# Altium schematic sheet 3_BQ25756 Charger.SchDoc
size A2; Date: Not shown in title block; ApprovedBy: Not shown in title block; CheckedBy: Not shown in title block; Author: Not shown in title block; CompanyName: Not shown in title block; Engineer: Not shown in title block; Organization: Not shown in title block; Address1: Not shown in title block; Address2: Not shown in title block; Address3: Not shown in title block; Address4: Not shown in title block; DocumentNumber: 1; Revision: Use project parameter SCH_Rev; SheetNumber: 3; SheetTotal: 4; PageSetup: Record=PageOptions|CenterHorizontal=True|CenterVertical=True|PrintScale=0.69|XCorrection=1.00|YCorrection=1.00|PrintKind=0|BorderSize=5000000|LeftOffset=0|BottomOffset=0|Orientation=2|PaperLength=1000|PaperWidth=1000|Scale=100|PaperSource=15|PrintQuality=600|MediaType=1|DitherType=10|PaperKind=Letter|PrintScaleMode=1; CurrentTime: Not shown in title block; CurrentDate: Not shown in title block; Time: Not shown in title block; DocumentFullPathAndName: Not shown in title block; DocumentName: Not shown in title block; ModifiedDate: Not shown in title block; ImagePath: Not shown in title block
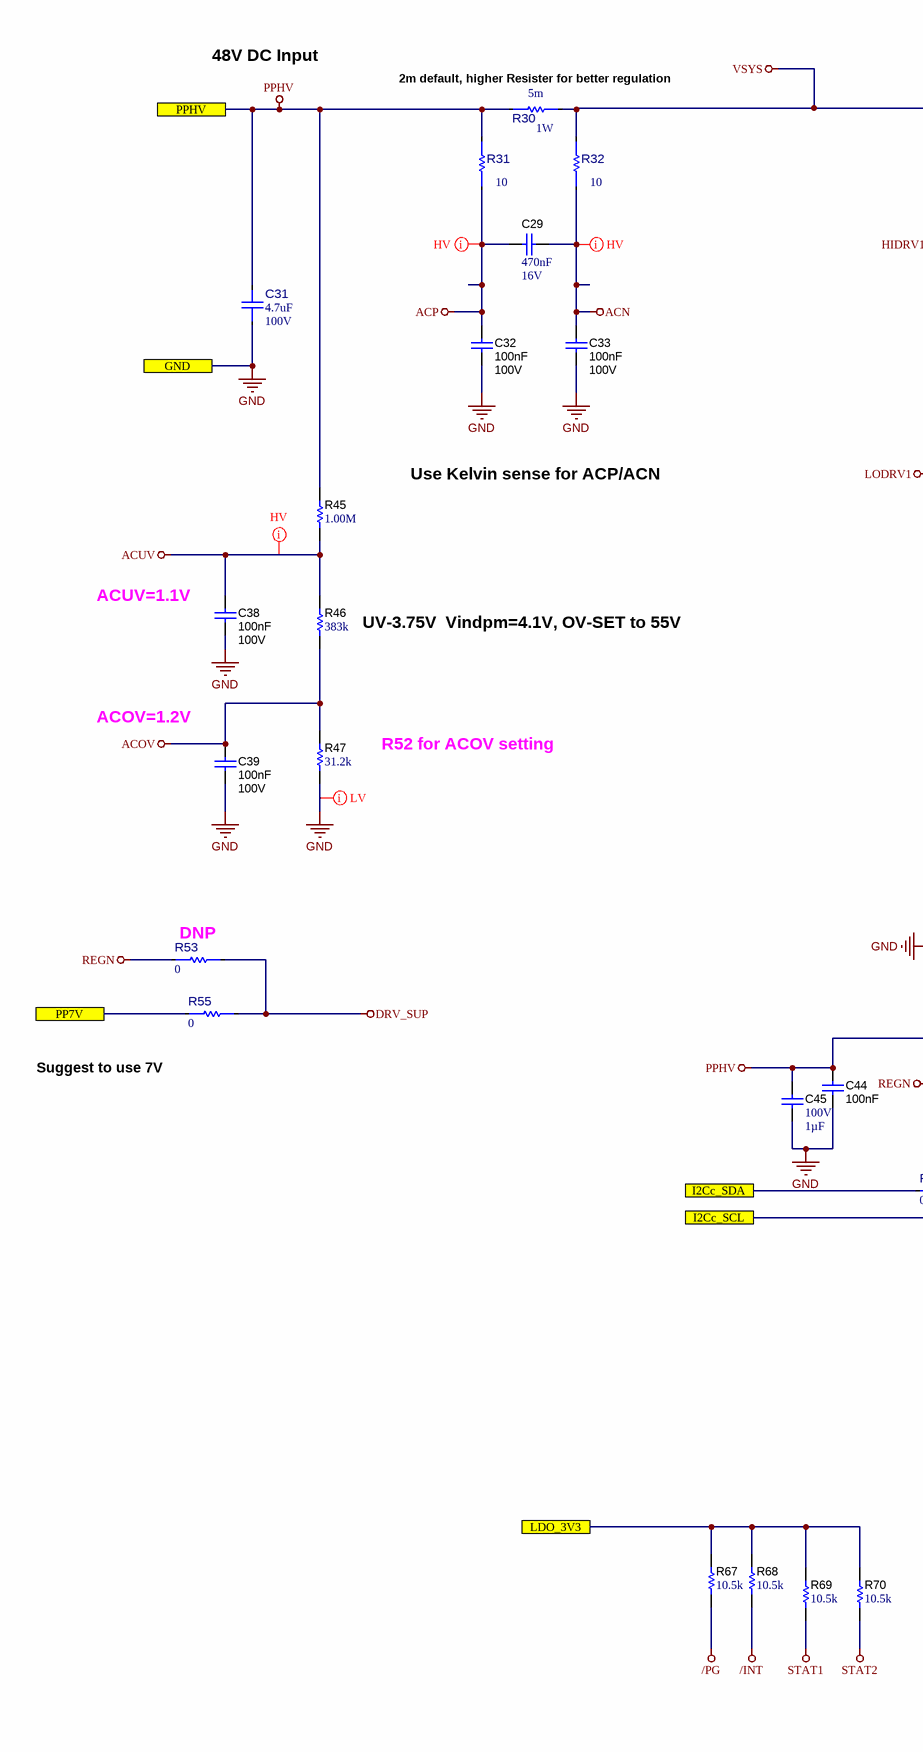
[diagram p0: 3_BQ25756 Charger.SchDoc, left]
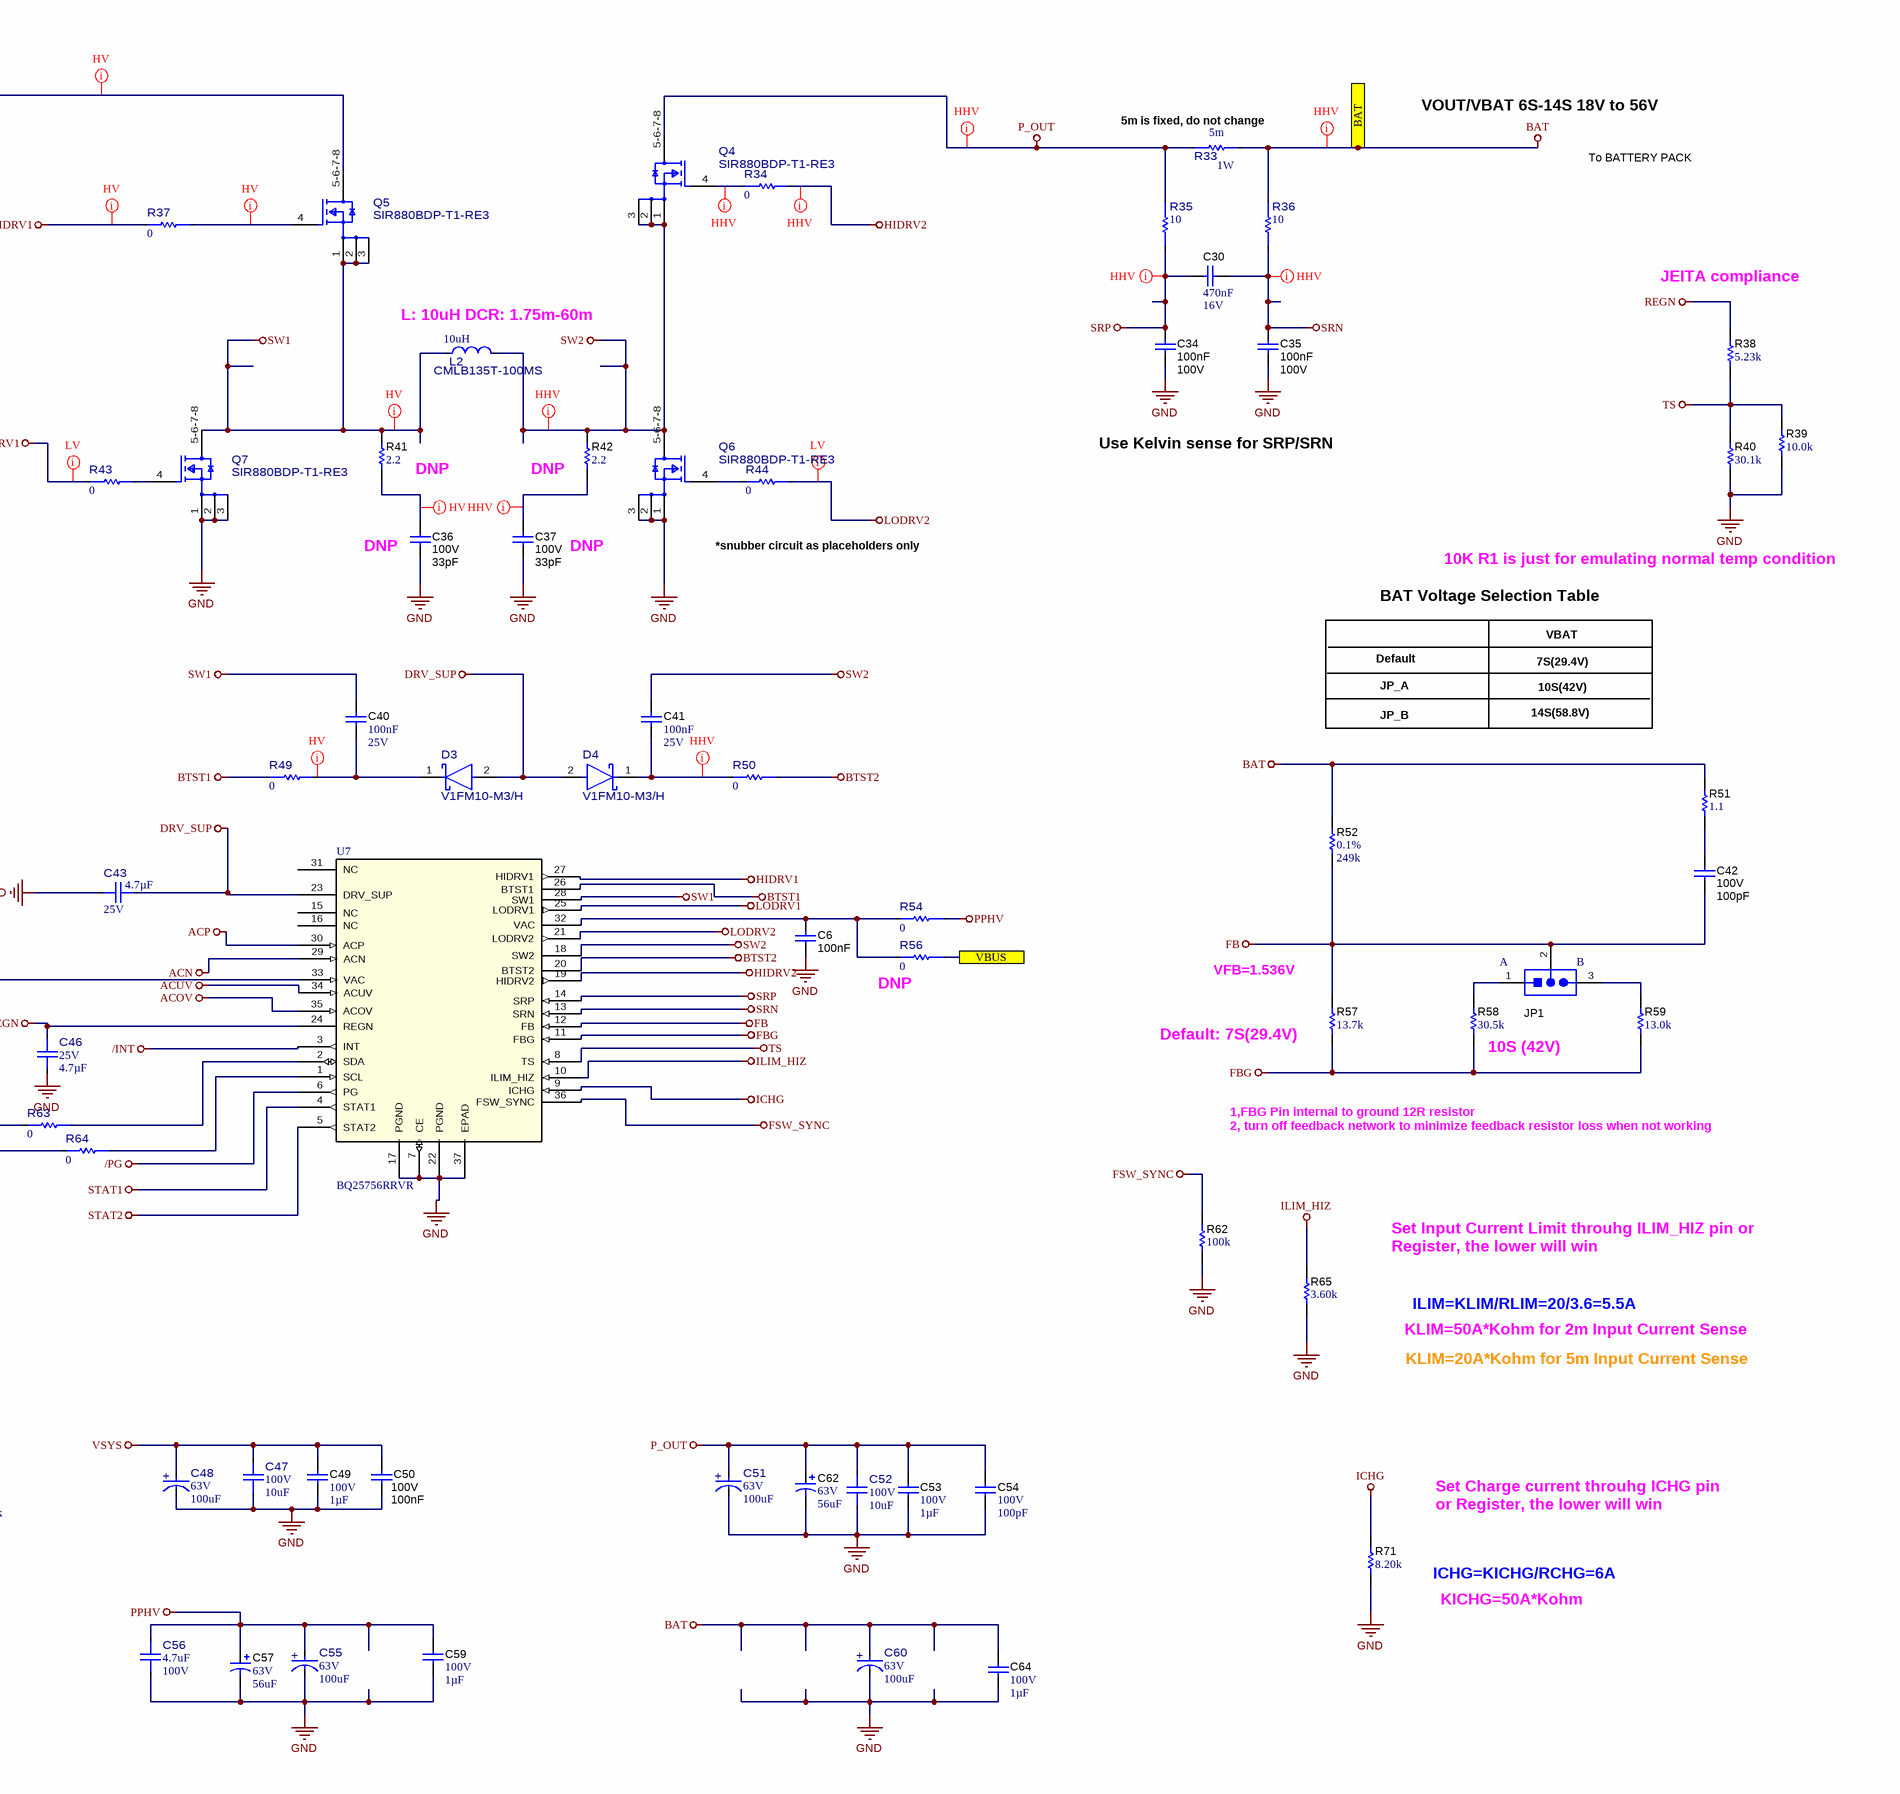
[diagram p1: 3_BQ25756 Charger.SchDoc, right]

## Parts
C6  Cap_F: 100nF  [0603_HV]  (hidden comment: HMK107B7104KAHT)
C29  Cap_F: 470nF  VDC_V: 16V  [0603]  (hidden comment: C0603C474K4RACTU)
C30  Cap_F: 470nF  VDC_V: 16V  [0603]  (hidden comment: C0603C474K4RACTU)
C31  ValueDisplayed: 4.7uF  VDC_V: 100V  [FP-GCJ32DC72A475KE01L_1210-MFG]  (hidden comment: GCJ32DC72A475KE01L)
C32  Cap_F: 100nF  VDC_V: 100V  [0603_HV]  (hidden comment: HMK107B7104KAHT)
C33  Cap_F: 100nF  VDC_V: 100V  [0603_HV]  (hidden comment: HMK107B7104KAHT)
C34  Cap_F: 100nF  VDC_V: 100V  [0603_HV]  (hidden comment: HMK107B7104KAHT)
C35  Cap_F: 100nF  VDC_V: 100V  [0603_HV]  (hidden comment: HMK107B7104KAHT)
C36  VDC_V: 100V  ValueDisplayed: 33pF  [0603_HV]  (hidden comment: 06031A330JAT2A)
C37  VDC_V: 100V  ValueDisplayed: 33pF  [0603_HV]  (hidden comment: 06031A330JAT2A)
C38  Cap_F: 100nF  VDC_V: 100V  [0603_HV]  (hidden comment: HMK107B7104KAHT)
C39  Cap_F: 100nF  VDC_V: 100V  [0603_HV]  (hidden comment: HMK107B7104KAHT)
C40  Cap_F: 100nF  VDC_V: 25V  [0603_HV]  (hidden comment: 06033C104KAT2A)
C41  Cap_F: 100nF  VDC_V: 25V  [0603_HV]  (hidden comment: 06033C104KAT2A)
C42  VDC_V: 100V  ValueDisplayed: 100pF  [0603_HV]  (hidden comment: GCM1885C2A101JA16D)
C43  VDC_V: 25V  Cap_F: 4.7µF  [FP-CGA4J1X7R1E475K125AE_0805-MFG]  (hidden comment: CGA4J1X7R1E475K125AE)
C44  Cap_F: 100nF  [0603_HV]  (hidden comment: HMK107B7104KAHT)
C45  VDC_V: 100V  Cap_F: 1µF  [0805_150]  (hidden comment: 08051C105K4Z2A)
C46  VDC_V: 25V  Cap_F: 4.7µF  [FP-CGA4J1X7R1E475K125AE_0805-MFG]  (hidden comment: CGA4J1X7R1E475K125AE)
C47  VDC_V: 100V  ValueDisplayed: 10uF  [FP-C3225X7R2A106K250AC_1210-MFG]  (hidden comment: C3225X7R2A106K250AC)
C48  VDC_V: 63V  ValueDisplayed: 100uF  [FP-PCR1J101MCL1GS_SMD_RADIAL-MFG]  (hidden comment: PCR1J101MCL1GS)
C49  VDC_V: 100V  Cap_F: 1µF  [0805_150]  (hidden comment: 08051C105K4Z2A)
C50  Cap_F: 100nF  VDC_V: 100V  [0603L]  (hidden comment: HMK107B7104KAHT)
C51  VDC_V: 63V  ValueDisplayed: 100uF  [FP-PCR1J101MCL1GS_SMD_RADIAL-MFG]  (hidden comment: PCR1J101MCL1GS)
C52  VDC_V: 100V  ValueDisplayed: 10uF  [FP-C3225X7R2A106K250AC_1210-MFG]  (hidden comment: C3225X7R2A106K250AC)
C53  VDC_V: 100V  Cap_F: 1µF  [0805_150]  (hidden comment: 08051C105K4Z2A)
C54  VDC_V: 100V  ValueDisplayed: 100pF  [0603]  (hidden comment: CGA3E2C0G2A101J080AA)
C55  VDC_V: 63V  ValueDisplayed: 100uF  [FP-PCR1J101MCL1GS_SMD_RADIAL-MFG]  (hidden comment: PCR1J101MCL1GS)
C56  ValueDisplayed: 4.7uF  VDC_V: 100V  [FP-GCJ32DC72A475KE01L_1210-MFG]  (hidden comment: GCJ32DC72A475KE01L)
C57  VDC_V: 63V  ValueDisplayed: 56uF  [SM_RADIAL_10BMM]  (hidden comment: EEHZC1J560P)
C59  VDC_V: 100V  Cap_F: 1µF  [0805_150]  (hidden comment: 08051C105K4Z2A)
C60  VDC_V: 63V  ValueDisplayed: 100uF  [FP-PCR1J101MCL1GS_SMD_RADIAL-MFG]  (hidden comment: PCR1J101MCL1GS)
C62  VDC_V: 63V  ValueDisplayed: 56uF  [SM_RADIAL_10BMM]  (hidden comment: EEHZC1J560P)
C64  VDC_V: 100V  Cap_F: 1µF  [0805_150]  (hidden comment: 08051C105K4Z2A)
D3  V1FM10-M3/H  [FP-V1FM10-M3-H_DO-219AB-MFG]
D4  V1FM10-M3/H  [FP-V1FM10-M3-H_DO-219AB-MFG]
JP1  PEC03SAAN  [CONN_PEC03SAAN]  (value not drawn)
L2  CMLB135T-100MS  value 10uH  [FP-CMLB135T-100MS_SMT2_13MM45_12Mm6-MFG]
Q4  SIR880BDP-T1-RE3  [FP-SIR880BDP-T1-RE3_SO-8-MFG]
Q5  SIR880BDP-T1-RE3  [FP-SIR880BDP-T1-RE3_SO-8-MFG]
Q6  SIR880BDP-T1-RE3  [FP-SIR880BDP-T1-RE3_SO-8-MFG]
Q7  SIR880BDP-T1-RE3  [FP-SIR880BDP-T1-RE3_SO-8-MFG]
R30  Res_ohm: 5m  Power_W: 1W  [FP-WSL25125L000FEA_2512-MFG]  (hidden comment: WSL25125L000FEA)
R31  value 10  [FP-CRCW060310R0FKEB_0603-MFG]  (hidden comment: CRCW060310R0FKEB)
R32  value 10  [FP-CRCW060310R0FKEB_0603-MFG]  (hidden comment: CRCW060310R0FKEB)
R33  Res_ohm: 5m  Power_W: 1W  [FP-WSL25125L000FEA_2512-MFG]  (hidden comment: WSL25125L000FEA)
R34  value 0  [FP-CRCW06031R50FKEAHP_0603-MFG]  (hidden comment: CRCW06030000Z0EA)
R35  value 10  [FP-CRCW060310R0FKEB_0603-MFG]  (hidden comment: CRCW060310R0FKEB)
R36  value 10  [FP-CRCW060310R0FKEB_0603-MFG]  (hidden comment: CRCW060310R0FKEB)
R37  value 0  [FP-CRCW06031R50FKEAHP_0603-MFG]  (hidden comment: CRCW06030000Z0EA)
R38  ValueDisplayed: 5.23k  [0603]  (hidden comment: RC0603FR-075K23L)
R39  ValueDisplayed: 10.0k  [0603]  (hidden comment: ERJ-3EKF1002V)
R40  ValueDisplayed: 30.1k  [0603]  (hidden comment: RC0603FR-0730K1L)
R41  ValueDisplayed: 2.2  [0805_HV]  (hidden comment: RC0805JR-072R2L)
R42  ValueDisplayed: 2.2  [0805_HV]  (hidden comment: RC0805JR-072R2L)
R43  value 0  [FP-CRCW06031R50FKEAHP_0603-MFG]  (hidden comment: CRCW06030000Z0EA)
R44  value 0  [FP-CRCW06031R50FKEAHP_0603-MFG]  (hidden comment: CRCW06030000Z0EA)
R45  ValueDisplayed: 1.00M  [0805_HV]  (hidden comment: CRCW08051M00FKEAC)
R46  ValueDisplayed: 383k  [0603]  (hidden comment: RT0603BRD07383KL)
R47  ValueDisplayed: 31.2k  [0603]  (hidden comment: RT0603BRD0731K2L)
R49  value 0  [FP-CRCW06031R50FKEAHP_0603-MFG]  (hidden comment: CRCW06030000Z0EA)
R50  value 0  [FP-CRCW06031R50FKEAHP_0603-MFG]  (hidden comment: CRCW06030000Z0EA)
R51  ValueDisplayed: 1.1  [0603]  (hidden comment: CRCW06031R10JNEA)
R52  Value1: 0.1%  ValueDisplayed: 249k  [0805_HV]  (hidden comment: ERJ-PB6B2493V)
R53  value 0  [FP-CRCW06031R50FKEAHP_0603-MFG]  (hidden comment: CRCW06030000Z0EA)
R54  value 0  [FP-CRCW06031R50FKEAHP_0603-MFG]  (hidden comment: CRCW06030000Z0EA)
R55  value 0  [FP-CRCW06031R50FKEAHP_0603-MFG]  (hidden comment: CRCW06030000Z0EA)
R56  value 0  [FP-CRCW06031R50FKEAHP_0603-MFG]  (hidden comment: CRCW06030000Z0EA)
R57  ValueDisplayed: 13.7k  [0603]  (hidden comment: RT0603BRD0713K7L)
R58  ValueDisplayed: 30.5k  [0603]  (hidden comment: RT0603BRD0730K5L)
R59  ValueDisplayed: 13.0k  [0603]  (hidden comment: RT0603BRD0713KL)
R62  ValueDisplayed: 100k  [0603]  (hidden comment: RC0603FR-07100KL)
R63  value 0  [FP-CRCW080510R0JNEAHP_0805-MFG]  (hidden comment: CRCW08050000Z0EA)
R64  value 0  [FP-CRCW080510R0JNEAHP_0805-MFG]  (hidden comment: CRCW08050000Z0EA)
R65  ValueDisplayed: 3.60k  [0603]  (hidden comment: RC0603FR-073K6L)
R67  ValueDisplayed: 10.5k  [0402]  (hidden comment: RC0402FR-0710K5L)
R68  ValueDisplayed: 10.5k  [0402]  (hidden comment: RC0402FR-0710K5L)
R69  ValueDisplayed: 10.5k  [0402]  (hidden comment: RC0402FR-0710K5L)
R70  ValueDisplayed: 10.5k  [0402]  (hidden comment: RC0402FR-0710K5L)
R71  ValueDisplayed: 8.20k  [0603]  (hidden comment: RG1608P-822-B-T5)
U7  BQ25756RRVR  [VQFN36_RRV_TEX]

## Ports
BAT, GND, I2Cc_SCL, I2Cc_SDA, LDO_3V3, PP7V, PPHV, VBUS

## Nets
/INT: R68.1 U7.3(INT)
/PG: R67.1 U7.6(PG)
ACN: C29.2 C33.1 R32.1 U7.29(ACN)
ACOV: C39.1 R46.1 R47.2 U7.35(ACOV)
ACP: C29.1 C32.1 R31.1 U7.30(ACP)
ACUV: C38.1 R45.1 R46.2 U7.34(ACUV)
BAT: C60.2(ANODE) C64.1 R33.2 R36.1 R51.2 R52.2 ; port BAT
BTST1: R49.1 U7.26(BTST1)
BTST2: R50.1 U7.20(BTST2)
DRV_SUP: C43.1 D3.2(ANODE) D4.2(ANODE) R53.2 R55.2 U7.23(DRV_SUP)
FB: C42.2 JP1.2 R52.1 R57.2 U7.12(FB)
FBG: R57.1 R58.1 R59.1 U7.11(FBG)
FSW_SYNC: R62.2 U7.36(FSW_SYNC)
GND: C6.1 C31.1 C32.2 C33.2 C34.2 C35.2 C36.2 C37.2 C38.2 C39.2 C43.2 C44.1 C45.2 C46.2 C47.1 C48.1(CATHODE) C49.2 C50.2 C51.1(CATHODE) C52.1 C53.2 C54.2 C55.1(CATHODE) C56.2 C57.2(-) C59.2 C60.1(CATHODE) C62.2(-) C64.2 Q6.1(S) Q6.2(S) Q6.3(S) Q7.1(S) Q7.2(S) Q7.3(S) R39.1 R40.1 R47.1 R62.1 R65.1 R71.1 U7.7(CE) U7.17(PGND) U7.22(PGND) U7.37(EPAD) ; port GND
HIDRV1: R37.2 U7.27(HIDRV1)
HIDRV2: R34.2 U7.19(HIDRV2)
ICHG: R71.2 U7.9(ICHG)
ILIM_HIZ: R65.2 U7.10(ILIM_HIZ)
LODRV1: R43.1 U7.25(LODRV1)
LODRV2: R44.1 U7.21(LODRV2)
P_OUT: C51.2(ANODE) C52.2 C53.1 C54.1 C62.1(+) Q4.5-6-7-8(D) R33.1 R35.1
PPHV: C31.2 C44.2 C45.1 C55.2(ANODE) C56.1 C57.1(+) C59.1 R30.1 R31.2 R45.2 R54.1 U7.33(VAC) ; port PPHV
REGN: C46.1 R38.2 R53.1 U7.24(REGN)
SRN: C30.2 C35.1 R36.2 U7.13(SRN)
SRP: C30.1 C34.1 R35.2 U7.14(SRP)
STAT1: R69.1 U7.4(STAT1)
STAT2: R70.1 U7.5(STAT2)
SW1: C40.1 L2.1 Q5.1(S) Q5.2(S) Q5.3(S) Q7.5-6-7-8(D) R41.2 U7.28(SW1)
SW2: C41.2 L2.2 Q4.1(S) Q4.2(S) Q4.3(S) Q6.5-6-7-8(D) R42.2 U7.18(SW2)
TS: R38.1 R39.2 R40.2 U7.8(TS)
VSYS: C47.2 C48.2(ANODE) C49.1 C50.1 Q5.5-6-7-8(D) R30.2 R32.2
I2Cc_SCL: R64.2 ; port I2Cc_SCL
I2Cc_SDA: R63.2 ; port I2Cc_SDA
LDO_3V3: R67.2 R68.2 R69.2 R70.2 ; port LDO_3V3
PP7V: R55.1 ; port PP7V
VBUS: R56.1 ; port VBUS
NetC6_2: C6.2 R54.2 R56.2 U7.32(VAC)
NetC36_1: C36.1 R41.1
NetC37_1: C37.1 R42.1
NetC40_2: C40.2 D3.1(CATHODE) R49.2
NetC41_1: C41.1 D4.1(CATHODE) R50.2
NetC42_1: C42.1 R51.1
NetJP1_1: JP1.1 R58.2
NetJP1_3: JP1.3 R59.2
NetQ4_4: Q4.4(G) R34.1
NetQ5_4: Q5.4(G) R37.1
NetQ6_4: Q6.4(G) R44.2
NetQ7_4: Q7.4(G) R43.2
NetR63_1: R63.1 U7.2(SDA)
NetR64_1: R64.1 U7.1(SCL)

Not connected (* = marked no-connect by the designer): U7 15(NC) 16(NC) 31(NC)

## Layout directives
net class HV: ACN, ACP, ACUV, HIDRV1, NetC36_1, NetC40_2, NetQ5_4, SW1, VSYS
net class HHV: BAT, HIDRV2, NetC37_1, NetC41_1, NetQ4_4, P_OUT, SRN, SRP, SW2
net class LV: GND, LODRV1, LODRV2

## Notes on the sheet
- 48V DC Input
- (near R30) 2m default, higher Resister for better regulation
- (near R33) 5m is fixed, do not change
- VOUT/VBAT 6S-14S 18V to 56V
- To BATTERY PACK
- (near L2) L: 10uH DCR: 1.75m-60m
- JEITA compliance
- Use Kelvin sense for ACP/ACN
- Use Kelvin sense for SRP/SRN
- DNP
- (near R42) DNP
- (near C38) ACUV=1.1V
- (near C36) DNP
- *snubber circuit as placeholders only
- 10K R1 is just for emulating normal temp condition
- (near R46) UV-3.75V  Vindpm=4.1V, OV-SET to 55V
- BAT Voltage Selection Table
- VBAT
- (near C39) ACOV=1.2V
- R52 for ACOV setting
- JP_A
- Default
- 7S(29.4V)
- 10S(42V)
- JP_B
- 14S(58.8V)
- (near R53) DNP
- Suggest to use 7V
- (near R56) DNP
- VFB=1.536V
- (near JP1) A
- (near JP1) B
- (near R57) Default: 7S(29.4V)
- (near R58) 10S (42V)
- 1,FBG Pin internal to ground 12R resistor
  2, turn off feedback network to minimize feedback resistor loss when not working
- Set Input Current Limit throuhg ILIM_HIZ pin or Register, the lower will win
- ILIM=KLIM/RLIM=20/3.6=5.5A
- KLIM=50A*Kohm for 2m Input Current Sense
- KLIM=20A*Kohm for 5m Input Current Sense
- Set Charge current throuhg ICHG pin or Register, the lower will win
- KICHG=50A*Kohm
- ICHG=KICHG/RCHG=6A
- Orderable:
- Designed for:
- Mod. Date:
- Texas Instruments and/or its licensors do not warrant the accuracy or completeness of this specification or any information contained therein. Texas Instruments and/or its licensors do not warrant that this design will meet the specifications, will be suitable for your application or fit for any particular purpose, or will operate in an implementation. Texas Instruments and/or its licensors do not warrant that the design is production worthy. You should completely validate and test your design implementation to confirm the system functionality for your application.
- Drawn By:
- Engineer:
- SVN Rev:
- Number:
- TID #:
- Rev:
- Sheet Title:
- File:
- Contact:
- Project Title:
- Assembly Variant:
- Sheet:
- Size:
- of
- A2
- © Texas Instruments
- http://www.ti.com
- (in symbol CMP-0089206-1) +

## Library data of the parts
C6 C44 = CMP-0081011-1: CAP, CERM, 0.1 µF, 100 V,+/- 10%, X7R, AEC-Q200 Grade 1, 0603; Manufacturer: Taiyo Yuden; SizeAreaWB_mm2: 4.68; SizeArea_mm2: 1.28; AEC Qualified: Y; AEC Category: Q200; Value: 0.1uF; TaMax_C: 125°C; SizeZ_mm: 1; Polarized: N; TaMin_C: -55°C; VDC_V: 100V; SizeY_mm: 0.8; U/M: EA; SizeX_mm: 1.6; Cap_Case: 0603; ValueDisplayed: 0.1µF; ComponentLink1Description: Datasheet link; RoHS: Y; Tolerance_%: 10%; Supplier 1: Digi-Key; PackageReference: 0603; Technology: Ceramic; PartNumber: HMK107B7104KAHT; TempCo: X7R; Supplier Part Number 2: 963-HMK107B7104KAHT; Supplier 2: Mouser; AEC Grade: 1; Value2: 100V; ComponentLink1URL: http://ds.yuden.co.jp/TYCOMPAS/ut/detail.do?productNo=HMK107B7104KAHT&fileName=HMK107B7104KAHT_SS&mode=specSheetDownload; CompType: Capacitor; MountType: SMT; Supplier Part Number 1: 587-6009-1-ND
C29 C30 = CMP-0006944-4: CAP, CERM, 0.47 uF, 16 V, +/- 10%, X7R, 0603; Manufacturer: Kemet; TaMin_C: -55°C; Polarized: N; SizeAreaWB_mm2: 4.68; Value1: Unknown; U/M: EA; Value: 0.47uF; TaMax_C: 125°C; SizeZ_mm: 1; SizeX_mm: 1.6; SizeY_mm: 0.8; SizeArea_mm2: 1.28; AEC Category: Q200; Supplier Part Number 2: 80-C0603C474K4R; Publisher: Texas Instruments; Supplier 2: Mouser; Supplier Part Number 3: 1414644; TempCo: X7R; Supplier 3: Farnell; Published: 2008-06-19; RoHS: Y; MountType: SMT; Supplier 1: Digi-Key; PackageReference: 0603; Tolerance_%: 10%; Cap_Case: 0603; Value2: 16V; CompType: Capacitor; LatestRevisionDate: 2017-03-09; PartNumber: C0603C474K4RACTU; AEC Qualified: ?; ComponentLink1Description: Datasheet link; Supplier Part Number 1: 399-4922-1-ND; Technology: Ceramic; ValueDisplayed: 0.47uF; ComponentLink1URL: http://www.kemet.com/kemet/web/homepage/kechome.nsf/vapubfiles/F3102_Y5V.pdf/$file/F3102_Y5V.pdf
C31 C56 = CMP-0093675-1: 4.7uF ±10% 100V Ceramic Capacitor X7S 1210 (3225 Metric); Manufacturer: Murata; Value: 4.7µF; AEC Qualified: Yes; TempCo: 22%; SizeZ_mm: 2.3mm; AEC Grade: Grade 1; Part Number: GCJ32DC72A475KE01L; helpURL: https://upverter.com/upn/revision/54580131a15fb126/; RoHS: TRUE; PartNumber: GCJ32DC72A475KE01L; PackageReference: 1210; ComponentLink1Description: Datasheet; Tolerance_%: 10%; Datasheet Path: datasheets/Cap-GCJ32DC72A475KE01L.pdf; Cap_F: 4.7µF; Lead Free: Yes; Operating Temperature Range: -55°C to +125°C; Temperature Characteristic: X7S; ComponentLink1URL: https://www.murata.com/en-us/products/productdetail?partno=GCJ32DC72A475KE01%23; datasheet: https://www.murata.com/en-us/products/productdetail?partno=GCJ32DC72A475KE01%23
C32-C35 C38 C39 C50 = CMP-0081011-1: CAP, CERM, 0.1 µF, 100 V,+/- 10%, X7R, AEC-Q200 Grade 1, 0603; Manufacturer: Taiyo Yuden; SizeAreaWB_mm2: 4.68; SizeArea_mm2: 1.28; AEC Qualified: Y; AEC Category: Q200; Value: 0.1uF; TaMax_C: 125°C; SizeZ_mm: 1; Polarized: N; TaMin_C: -55°C; SizeY_mm: 0.8; U/M: EA; SizeX_mm: 1.6; Cap_Case: 0603; ValueDisplayed: 0.1µF; ComponentLink1Description: Datasheet link; RoHS: Y; Tolerance_%: 10%; Supplier 1: Digi-Key; PackageReference: 0603; Technology: Ceramic; PartNumber: HMK107B7104KAHT; TempCo: X7R; Supplier Part Number 2: 963-HMK107B7104KAHT; Supplier 2: Mouser; AEC Grade: 1; Value2: 100V; ComponentLink1URL: http://ds.yuden.co.jp/TYCOMPAS/ut/detail.do?productNo=HMK107B7104KAHT&fileName=HMK107B7104KAHT_SS&mode=specSheetDownload; CompType: Capacitor; MountType: SMT; Supplier Part Number 1: 587-6009-1-ND
C36 C37 = CMP-0006722-4: CAP, CERM, 33 pF, 100 V, +/- 5%, C0G/NP0, 0603; Manufacturer: AVX; TaMin_C: -55°C; ESR_ohm: 0.209; Polarized: N; SizeAreaWB_mm2: 4.68; Value1: 0.209 ohm; U/M: EA; Value: 33pF; TaMax_C: 125°C; SizeZ_mm: 1; SizeX_mm: 1.6; SizeY_mm: 0.8; Cap_Case: 0603; SizeArea_mm2: 1.28; AEC Category: Q200; Supplier Part Number 2: 96M1221; Publisher: Texas Instruments; Supplier 2: Newark; Supplier Part Number 3: 581-06031A330J; TempCo: C0G/NP0; Supplier 3: Mouser; Published: 2008-06-19; RoHS: Y; MountType: SMT; Supplier 1: Digi-Key; PackageReference: 0603; Tolerance_%: 5%; Value2: 100V; CompType: Capacitor; LatestRevisionDate: 2017-03-09; PartNumber: 06031A330JAT2A; AEC Qualified: N; Cap_F: 33pF; ComponentLink1Description: Datasheet link; AEC Grade: N/A; Supplier Part Number 1: 478-1143-1-ND; Technology: Ceramic; ComponentLink1URL: http://datasheets.avx.com/C0GNP0-Dielectric.pdf
C40 C41 = CMP-0006753-4: CAP, CERM, 0.1 uF, 25 V, +/- 10%, X7R, 0603; Manufacturer: AVX; TaMin_C: -55°C; ESR_ohm: 50m; Polarized: N; SizeAreaWB_mm2: 4.68; Value1: 0.05 ohm; U/M: EA; Value: 0.1uF; TaMax_C: 125°C; SizeZ_mm: 1; SizeX_mm: 1.6; SizeY_mm: 0.8; Cap_Case: 0603; SizeArea_mm2: 1.28; AEC Category: Q200; Supplier Part Number 2: 96M1263; Publisher: Texas Instruments; Supplier 2: Newark; Supplier Part Number 3: 581-06033C104KAT2A; TempCo: X7R; Supplier 3: Mouser; Published: 2008-06-19; RoHS: Y; MountType: SMT; Supplier 1: Digi-Key; PackageReference: 0603; Tolerance_%: 10%; Value2: 25V; CompType: Capacitor; LatestRevisionDate: 2017-03-09; PartNumber: 06033C104KAT2A; AEC Qualified: N; ComponentLink1Description: Datasheet link; AEC Grade: N/A; Supplier Part Number 1: 478-3714-1-ND; Technology: Ceramic; ValueDisplayed: 0.1uF; ComponentLink1URL: http://datasheets.avx.com/X7RDielectric.pdf
C42 = CMP-0007130-4: CAP, CERM, 100 pF, 100 V, +/- 5%, C0G/NP0, AEC-Q200 Grade 1, 0603; Manufacturer: MuRata; TaMin_C: -55°C; Polarized: N; SizeAreaWB_mm2: 4.68; Value1: Unknown; U/M: EA; TaMax_C: 125°C; SizeZ_mm: 1; SizeX_mm: 1.6; SizeY_mm: 0.8; Cap_Case: 0603; SizeArea_mm2: 1.28; AEC Qualified: Y; AEC Category: Q200; Value: 100pF; Supplier Part Number 2: 81-GCM1885C2A101JA6D; Publisher: Texas Instruments; Supplier 2: Mouser; TempCo: C0G/NP0; Published: 2008-06-19; RoHS: Y; MountType: SMT; Supplier 1: Digi-Key; PackageReference: 0603; Tolerance_%: 5%; Value2: 100V; CompType: Capacitor; LatestRevisionDate: 2017-03-09; PartNumber: GCM1885C2A101JA16D; Cap_F: 100pF; ComponentLink1Description: Datasheet link; AEC Grade: 1; Supplier Part Number 1: 490-4771-1-ND; Technology: Ceramic; ComponentLink1URL: http://psearch.murata.com/capacitor/product/GCM1885C2A101JA16%23.pdf
C43 C46 = CMP-0093626-1: Cap Ceramic 4.7uF 25V X7R 10% Pad SMD 0805 +125°C Automotive T/R; Manufacturer: TDK Corporation; SizeZ_mm: 1.45mm; TempCo: 15%; AEC Qualified: Yes; Value: 4.7µF; Tolerance_%: 0.1%; AEC Grade: Grade 1; helpURL: https://upverter.com/upn/revision/748290ea9605f801/; ComponentLink1Description: Datasheet; ValueDisplayed: 4.7uF; Temperature Characteristic: X7R; Datasheet Path: datasheets/Cap-CGA4J1X7R1E475K125AE.pdf; Lead Free: Yes; Operating Temperature Range: -55°C to +125°C; PartNumber: CGA4J1X7R1E475K125AE; ComponentLink1URL: https://product.tdk.com/info/en/catalog/datasheets/mlcc_automotive_soft_en.pdf; RoHS: TRUE; Part Number: CGA4J1X7R1E475K125AE; datasheet: https://product.tdk.com/info/en/catalog/datasheets/mlcc_automotive_soft_en.pdf; PackageReference: 0805
C45 C49 C53 C59 C64 = CMP-0861070-1: CAP, CERM, 1 µF, 100 V,+/- 10%, X7R, AEC-Q200 Grade 1, 0805; Manufacturer: AVX; SizeZ_mm: 1.5; Polarized: N; TaMax_C: 125°C; TaMin_C: -55°C; Value: 1uF; AEC Qualified: Y; U/M: EA; AEC Grade: 1; Cap_Case: 0805; SizeX_mm: 2; SizeArea_mm2: 2.5; SizeAreaWB_mm2: 6.75; AEC Category: Q200; SizeY_mm: 1.25; Technology: Ceramic; RoHS: Y; PartNumber: 08051C105K4Z2A; MountType: SMT; ValueDisplayed: 1µF; ComponentLink1URL: http://datasheets.avx.com/AutoMLCC.pdf; TempCo: X7R; CompType: Capacitor; ComponentLink1Description: Datasheet link; Tolerance_%: 10%; PackageReference: 0805; Value2: 100V
C47 C52 = CMP-0096021-1: 10 µF ±10% 100V Ceramic Capacitor X7R 1210 (3225 Metric); Manufacturer: TDK; Cap_F: 10µF; AEC Qualified: No; Value: 10µF; SizeZ_mm: 2.85mm; TempCo: 15%; RoHS: TRUE; Digikey Part Number: 445-C3225X7R2A106K250ACCT-ND; Mouser Description: Multilayer Ceramic Chip Capacitors, Capacitance=10µF, LxWxT: 3.2x2.5x2.5mm; Mouser Part Number: 810-C3225X7R2A106K25; Supplier Part Number 1: 445-C3225X7R2A106K250ACCT-ND; Datasheet Path: datasheets/Cap-C3225X7R2A106K250AC.pdf; PackageReference: 1210; Lead Free: Yes; helpURL: https://upverter.com/upn/revision/84742aafcccd6735/; Digikey Description: COMMERCIAL GRADE GENERAL PURPOSE; Tolerance_%: 10%; datasheet: https://product.tdk.com/en/search/capacitor/ceramic/mlcc/info?part_no=C3225X7R2A106K250AC; Part Number: C3225X7R2A106K250AC; Supplier Part Number 2: 810-C3225X7R2A106K25; Operating Temperature Range: -55°C to +125°C; ComponentLink1URL: https://product.tdk.com/en/search/capacitor/ceramic/mlcc/info?part_no=C3225X7R2A106K250AC; Supplier 1: Digikey; Temperature Characteristic: X7R; PartNumber: C3225X7R2A106K250AC; ComponentLink1Description: Datasheet; Supplier 2: Mouser
C48 C51 C55 C60 = CMP-0089206-1: 100uF 63V Polymer ALUM Electrolytic Capacitor, CR Series 4000h 10.3x10.3x12.6mm; Manufacturer: Nichicon; Tolerance_%: 20%; AEC Grade: Grade 1; Cap_F: 100µF; IRMS_A: 3A; Life: 4000Hours; AEC Qualified: Yes; SizeZ_mm: 12.7mm; Dissipation Factor: 8%; Esr: 24m; Leakage Current: 189uA; Device Class L1: Passive Components; Digikey Part Number: 493-13783-1-ND; Lead Free: Yes; Supplier 1: Digikey; Device Class L3: Aluminum Electrolytic Capacitors; PackageReference: SMD_RADIAL; ComponentLink1Description: Datasheet; Supplier Part Number 1: 493-13783-1-ND; Device Class L2: Capacitors; Digikey Description: CAP ALUM POLY 100UF 20% 63V SMD; Mouser Part Number: 647-PCR1J101MCL1GS; RoHS: TRUE; datasheet: https://www.nichicon.co.jp/english/products/pdfs/e-pcr.pdf; helpURL: https://upverter.com/upn/revision/74832c365c15f87b/; Part Number: PCR1J101MCL1GS; Supplier 2: Mouser; Datasheet Path: datasheets/Cap-PCR1J101MCL1GS.pdf; Operating Temperature Range: -55°C to +125°C; PartNumber: PCR1J101MCL1GS; ComponentLink1URL: https://www.nichicon.co.jp/english/products/pdfs/e-pcr.pdf; Supplier Part Number 2: 647-PCR1J101MCL1GS
C54 = CMP-0007237-3: Multilayer Ceramic Capacitors MLCC - SMD/SMT CGA 0603 100V 100pF C0G 5% AEC-Q200; Manufacturer: TDK; TaMin_C: -55°C; Polarized: N; TempCo: C0G/NP0; SizeAreaWB_mm2: 4.68; Value1: Unknown; U/M: EA; TaMax_C: 125°C; SizeZ_mm: 1; SizeX_mm: 1.6; SizeY_mm: 0.8; SizeArea_mm2: 1.28; AEC Category: Q200; Supplier Part Number 2: CGA3E2C0G2A101J080AA; Publisher: Texas Instruments; Supplier 2: Mouser; Supplier Part Number 3: 1828919; Supplier 3: Farnell; Published: 2008-06-19; RoHS: Y; MountType: SMT; Value: 100pF; Supplier 1: Digi-Key; PackageReference: 0603; Tolerance_%: 5%; Cap_Case: 0603; Value2: 100V; CompType: Capacitor; LatestRevisionDate: 2017-03-09; PartNumber: CGA3E2C0G2A101J080AA; AEC Qualified: ?; Cap_F: 100pF; ComponentLink1Description: Datasheet link; Supplier Part Number 1: 490-1351-1-ND; Technology: Ceramic; ComponentLink1URL: http://search.murata.co.jp/Ceramy/PnsearchViewAction.do?HnOFG=ON&HnNFG=ON&SEL_CNT=50&sLang=en&sKey=GRM1885C2A101JA01D&x=9&y=9&search=startwith
C57 C62 = CMP-0012603-3: CAP, Polymer Hybrid, 56 uF, 63 V, +/- 20%, 30 ohm, 10x10 SMD; Manufacturer: Panasonic; TaMin_C: -55°C; ESR_ohm: 30; Polarized: Y; SizeAreaWB_mm2: 159.9; Value1: 30 ohm; Value: 56uF; TaMax_C: 125°C; SizeZ_mm: 10.2; SizeX_mm: 11; SizeY_mm: 10.3; SizeArea_mm2: 113.3; CompType: Capacitor; Cap_F: 56µF; IRMS_A: 1.4A; AEC Category: Q200; RoHS: Y; MountType: SMT; Supplier 1: Digi-Key; PackageReference: 10x10; Tolerance_%: 20%; Value2: 63V; PartNumber: EEHZC1J560P; AEC Qualified: ?; Series: ZC; ComponentLink1Description: Datasheet link; Supplier Part Number 1: P15469CT-ND; Technology: Polymer Hybrid; ComponentLink1URL: http://industrial.panasonic.com/www-data/pdf/ABA0000/ABA0000CE138.pdf
D3 D4 = CMP-0093639-2: Diode Schottky 1A Surface Mount DO-219AB (SMF); Manufacturer: Vishay; Max Surge Forward Current: 30A; TJmax_C: 175°C; AEC Qualified: No; Cap_F: 95pF; AEC Category: Q101; Standoff Height: 0mm; SizeZ_mm: 1.08mm; Vr_V: 100V; Peak Reverse Current: 0.2uA; Part Number: V1FM10-M3/H; helpURL: https://upverter.com/upn/revision/746fedbc755f5789/; Operating Temperature Range: -40°C to +175°C; Digikey Description: 1A 100V SMF TRENCH SKY RECT; Mouser Part Number: 78-V1FM10-M3/H; Forward Current: 1A; PackageReference: DO-219AB; ValueDisplayed: 95pF; RoHS: TRUE; Mouser Description: Rectifier Diode Schottky 100V 1A 2-Pin SMF T/R; Lead Free: Yes; Datasheet Path: datasheets/Diode-V1FM10-M3-H.pdf; ComponentLink1Description: Datasheet; datasheet: https://www.vishay.com/docs/87557/v1fm10.pdf; ComponentLink1URL: https://www.vishay.com/docs/87557/v1fm10.pdf; Digikey Part Number: 112-V1FM10-M3/HCT-ND; CompType: Diode; PartNumber: V1FM10-M3/H; Vf_V: 100V
JP1 = CMP-0002338-1: Header, 100mil, 3x1, Tin, TH; Manufacturer: Sullins Connector Solutions; Cert_UL: Y; CNHeader: TRUE; CT: FALSE; Current_A: 3A; Gender: Male; Green_Lifecycle: Not Set; Green_REACh: Incomplete; Pitch_mm: 2.54; Row_Count: 1; Shrouded: N; Voltage_V: 1.8kV; PartNumber: PEC03SAAN; PackageReference: Header, 3 PIN, 100mil, Tin; CompType: Header; RoHS: Y; MountType: TH; ComponentLink1Description: Datasheet URL; ComponentLink1URL: http://www.sullinscorp.com/catalogs/77_PAGE108-109_.100_MALE_HDR.pdf; Publisher: Texas Instruments; LatestRevisionDate: 26/05/2017; Supplier 1: Digi-Key; Supplier Part Number 1: S1012E-03-ND; ClassName: Header; Color: Black; ContactFinish: Tin; Green_EU RoHS-2: Incomplete; Green_EU RoHS: Incomplete; Orientation: Vertical; PinCount: 3
L2 = CMP-0096007-1: Power Choke Coil 10uH 20% 9A 22mOhm; Manufacturer: Cyntec; Material: Metal Dust; SizeZ_mm: 5mm; Standoff Height: 0mm; Ind_H: 10µH; AEC Qualified: No; Isat: 10.5A; Test Frequency: 100kHz; DCR_ohm: 22m; Tolerance_%: 20%; PartNumber: CMLB135T-100MS; RoHS: TRUE; Lead Free: Yes; Datasheet Path: datasheets/Ind-CMLB135T-100MS.pdf; ComponentLink1URL: https://www.cyntec.com/upfile/products/download/CMLB135T-000%20(A6).pdf; ComponentLink1Description: Datasheet; Part Number: CMLB135T-100MS; Irms: 9A; Operating Temperature Range: -55°C to +125°C; datasheet: https://www.cyntec.com/upfile/products/download/CMLB135T-000%20(A6).pdf; helpURL: https://upverter.com/upn/revision/6710307a1186a91b/; PackageReference: SMT2_13MM45_12Mm6
Q4-Q7 = CMP-0096839-1: N-Channel 80 V 18.6A (Ta), 70.6A (Tc) 5W (Ta), 71.4W (Tc) Surface Mount PowerPAK® SO-8; Manufacturer: Vishay; QgTyp_nC: 43.5nC @ 10V; Turn On Delay Time: 12ns; Rthja Max: 20°C/W; Turn Off Delay Time: 40ns; Reverse Recovery Charge: 52nC; Typ Forward Diode Voltage: 0.74V; VdsMax_V: 1.1V; SizeZ_mm: 1.12mm; Number Of Channels: 1; Pulse Drain Current: 200A; Threshold Vgs Min: 1V; TJmax_C: +150°C; AEC Qualified: No; Transconductance: 49S; ChMode: False; Reverse Recovery Time: 38ns; Threshold Vgs Max: 2.4V; Input Capacitace At Vds: 2930pF @ 40V; Vgs_V: 20V; Drain To Source Breakdown Voltage: 80V; Rdson45_ohm: 5.3m; Datasheet Path: datasheets/Trans-SIR880BDP-T1-RE3.pdf; ComponentLink1Description: Datasheet; Lead Free: Yes; PackageReference: SO-8; Mouser Part Number: 78-SIR880BDP-T1-RE3; datasheet: https://www.vishay.com/docs/63031/sir880bdp.pdf; Digikey Part Number: 742-SIR880BDP-T1-RE3CT-ND; RoHS: TRUE; helpURL: https://upverter.com/upn/revision/df129d86407baf6e/; Power_W: 5W; Number Of N Channels: 1; Digikey Description: N-CHANNEL 80-V (D-S) MOSFET POWE; Part Number: SIR880BDP-T1-RE3; ComponentLink1URL: https://www.vishay.com/docs/63031/sir880bdp.pdf; PartNumber: SIR880BDP-T1-RE3; Operating Temperature Range: -55°C to +150°C; IdsMax_A: 18.6A
R30 R33 = CMP-0096841-1: Res Metal Strip 2512 0.005 Ohm 1% 1W 110ppm/C Molded SMD SMD Embossed Plastic T/R; Manufacturer: Vishay; TempCo: 110ppm/°C; AEC Grade: Grade 0; AEC Qualified: Yes; Category 5A00970A6D5C81C7: Uncategorized; Value: 5m; Category 5C6A91606D4187Ad: Resistors; Category Cd01000Bfc2916C6: Single Components; Category 7542B8484461Ae85: Passive Components; SizeZ_mm: 0.889mm; Series: WSL; Mouser Part Number: 71-WSL25125L000FEA; Mouser Description: Current Sense Resistors - SMD 1watt .005ohms 1%; Supplier 2: Mouser; Lead Free: Yes; PackageReference: 2512; Digikey Part Number: WSLG-.005CT-ND; Tolerance_%: 1%; Supplier Part Number 2: 71-WSL25125L000FEA; Part Number: WSL25125L000FEA; RoHS: TRUE; helpURL: https://upverter.com/upn/revision/4a960a7eb29c827a/; ComponentLink1Description: Datasheet; PartNumber: WSL25125L000FEA; Technology: Metal Element; ComponentLink1URL: https://www.vishay.com/docs/30100/wsl.pdf; Octopart Part Number: dd8716d1bbbb0240; datasheet: https://www.vishay.com/docs/30100/wsl.pdf; Supplier 1: Digikey; Operating Temperature Range: -65°C to +170°C; Supplier Part Number 1: WSLG-.005CT-ND; Digikey Description: RES 0.005 OHM 1% 1W 2512; Datasheet Path: datasheets/Res-WSL25125L000FEA.pdf
R31 R32 R35 R36 = CMP-0093685-1: RES Thick Film, 10Ω, 1%, 0.1W, 100ppm/°C, 0603; Manufacturer: Vishay; Approved Alternate Part Number: 541-1.00HHCT-ND; Power_W: 100mW; Voltage: 75V; SizeZ_mm: 0.5mm; AEC Grade: Grade 0; AEC Qualified: Yes; RoHS: TRUE; Tolerance_%: 1%; ComponentLink1URL: http://www.vishay.com/docs/20035/dcrcwe3.pdf; VDC_V: 75V; PackageReference: 0603; Res_ohm: 10; Operating Temperature Range: -55°C to +155°C; Power: 100mW; Part Number: CRCW060310R0FKEB; datasheet: http://www.vishay.com/docs/20035/dcrcwe3.pdf; Series: D/CRCW e3; PartNumber: CRCW060310R0FKEB; ComponentLink1Description: Datasheet; Datasheet Path: datasheets/Res-CRCW060310R0FKEB.pdf; helpURL: https://upverter.com/upn/revision/3a87135a4406d73b/; Lead Free: Yes; TempCo: 100ppm/°C; Technology: Thick Film
R34 R37 R43 R44 R49 R50 R53-R56 = CMP-0093629-1: Thick Film Resistors - SMD 1/10watt ZEROohm Jumper; Manufacturer: Vishay; AEC Grade: Grade 0; TempCo: 100ppm/°C; Power: 250mW; Res_ohm: 1.5; Power_W: 330mW; AEC Qualified: Yes; VDC_V: 75V; SizeZ_mm: 0.55mm; Tolerance_%: 1%; PartNumber: CRCW06030000Z0EA; helpURL: https://upverter.com/upn/revision/04facc8566ca24c1/; PackageReference: 0603; ComponentLink1Description: Datasheet; Series: CRCW-HP e3; Technology: Thick Film; Part Number: CRCW06030000Z0EA; Operating Temperature Range: -55°C to +155°C; Datasheet Path: datasheets/Res-CRCW06031R50FKEAHP.pdf; ComponentLink1URL: http://www.vishay.com/docs/20043/crcwhpe3.pdf; Lead Free: Yes; RoHS: TRUE; datasheet: http://www.vishay.com/docs/20043/crcwhpe3.pdf
R38 = CMP-0023199-5: RES, 5.23 k, 1%, 0.1 W, 0603; Manufacturer: Yageo; Power_W: 100mW; TempCo: 100 ppm/C; Value_Code: 5k23; Value: 5.23k; EIA_Code: E96; SizeX_mm: 1.6; SizeY_mm: 0.8; SizeZ_mm: 1; Value2: 0.1W; SizeArea_mm2: 1.28; AEC Qualified: N; VDC_V: 75V; AEC Category: Q200; SizeAreaWB_mm2: 4.68; Supplier Part Number 2: 603-RC0603FR-075K23L; Supplier 2: Mouser; Supplier Part Number 3: 9238573; Supplier 3: Farnell; RoHS: Y; Value1: 1%; MountType: SMT; Supplier 1: Digi-Key; PackageReference: 0603; Tolerance_%: 1%; Res_ohm: 5.23k; CompType: Resistor; PartNumber: RC0603FR-075K23L; ComponentLink1Description: Datasheet link; Supplier Part Number 1: 311-5.23KHRCT-ND; Technology: Thick Film; ComponentLink1URL: http://www.yageo.com/pdf/Pu-RC0603_51_PbFree_L_2.pdf; AEC Grade: N/A
R39 = CMP-0022684-2: RES, 10.0 k, 1%, 0.1 W, 0603; Manufacturer: Panasonic; Power_W: 100mW; TempCo: 100 ppm/C; Value_Code: 10k0; U/M: EA; Value: 10.0k; EIA_Code: E96; Res_ohm: 10k; SizeX_mm: 1.6; SizeY_mm: 0.8; SizeZ_mm: 1; Value2: 0.1W; SizeArea_mm2: 1.28; VDC_V: 75V; AEC Category: Q200; Supplier Part Number 2: 64R5309; Publisher: Texas Instruments; Supplier 2: Newark; Supplier Part Number 3: 667-ERJ-3EKF1002V; Supplier 3: Mouser; Published: 2008-06-26; RoHS: Y; Value1: 1%; MountType: SMT; Supplier 1: Digi-Key; PackageReference: 0603; Tolerance_%: 1%; CompType: Resistor; LatestRevisionDate: 2017-03-09; PartNumber: ERJ-3EKF1002V; AEC Qualified: ?; ComponentLink1Description: Datasheet link; Supplier Part Number 1: P10.0KHCT-ND; Technology: Thick Film; ComponentLink1URL: http://industrial.panasonic.com/www-data/pdf/AOA0000/AOA0000CE2.pdf
R40 = CMP-0023018-5: RES, 30.1 k, 1%, 0.1 W, 0603; Manufacturer: Yageo; Power_W: 100mW; TempCo: 100 ppm/C; Value_Code: 30k1; Value: 30.1k; EIA_Code: E96; SizeX_mm: 1.6; SizeY_mm: 0.8; SizeZ_mm: 1; Value2: 0.1W; SizeArea_mm2: 1.28; AEC Qualified: N; VDC_V: 75V; AEC Category: Q200; SizeAreaWB_mm2: 4.68; Supplier Part Number 2: 603-RC0603FR-0730K1L; Supplier 2: Mouser; Supplier Part Number 3: 1799339; Supplier 3: Farnell; RoHS: Y; Value1: 1%; MountType: SMT; Supplier 1: Digi-Key; PackageReference: 0603; Tolerance_%: 1%; Res_ohm: 30.1k; CompType: Resistor; PartNumber: RC0603FR-0730K1L; ComponentLink1Description: Datasheet link; Supplier Part Number 1: 311-30.1KHRCT-ND; Technology: Thick Film; ComponentLink1URL: http://www.yageo.com/pdf/Pu-RC0603_51_PbFree_L_2.pdf; AEC Grade: N/A
R41 R42 = CMP-0020812-2: RES, 2.2, 5%, 0.125 W, 0805; Manufacturer: Yageo America; Power_W: 125mW; TempCo: 200 ppm/C; Value_Code: 2R20; U/M: EA; Value: 2.2; EIA_Code: E24; SizeX_mm: 2; SizeY_mm: 1.25; SizeZ_mm: 1.45; Value2: 0.125W; SizeArea_mm2: 2.5; VDC_V: 150V; AEC Category: Q200; Supplier Part Number 2: 603-RC0805JR-072R2L; Publisher: Texas Instruments; Supplier 2: Mouser; Supplier Part Number 3: 1799490; Supplier 3: Farnell; Published: 2008-06-26; RoHS: Y; Value1: 5%; MountType: SMT; Supplier 1: Digi-Key; PackageReference: 0805; Tolerance_%: 5%; Res_ohm: 2.2; CompType: Resistor; LatestRevisionDate: 2017-03-09; PartNumber: RC0805JR-072R2L; AEC Qualified: ?; ComponentLink1Description: Datasheet link; Supplier Part Number 1: 311-2.2ARCT-ND; Technology: Thick Film; ComponentLink1URL: http://www.yageo.com/pdf/Pu-RC0805_51_PbFree_L_2.pdf
R45 = CMP-0021522-3: Thick Film Resistors - SMD 1/8Watt 1Mohms 1% Commercial Use; Manufacturer: Vishay / Dale; Power_W: 125mW; TempCo: 100 ppm/C; Value_Code: 1M00; Value: 1.00Meg; EIA_Code: E96; Res_ohm: 1M; SizeX_mm: 2; SizeY_mm: 1.25; SizeZ_mm: 1.45; Value2: 0.125W; SizeArea_mm2: 2.5; AEC Qualified: Y; AEC Category: Q200; AEC Grade: 0; SizeAreaWB_mm2: 6.75; Supplier Part Number 2: 667-ERJ-6ENF1004V; Supplier 2: Mouser; Supplier Part Number 3: 1748405; Supplier 3: Farnell; RoHS: Y; Value1: 1%; MountType: SMT; Supplier 1: Digi-Key; PackageReference: 0805; Tolerance_%: 1%; CompType: Resistor; PartNumber: CRCW08051M00FKEAC; ComponentLink1Description: Datasheet link; Supplier Part Number 1: P1.00MCCT-ND; Technology: Thick Film; ComponentLink1URL: https://industrial.panasonic.com/cdbs/www-data/pdf/RDA0000/AOA0000C304.pdf
R46 = CMP-0024170-1: RES, 383 k, 0.1%, 0.1 W, 0603; Manufacturer: Yageo America; Power_W: 100mW; TempCo: 25 ppm/C; U/M: EA; Value: 383k; EIA_Code: E192; SizeX_mm: 1.6; SizeY_mm: 0.8; SizeZ_mm: 1; Value2: 0.1W; SizeArea_mm2: 1.28; VDC_V: 75V; AEC Category: Q200; ComponentLink1URL: http://www.yageo.com/pdf/PYu-RT_1-to-0.05_RoHS_L_3.pdf; Publisher: Texas Instruments; Published: 2008-06-26; Value_Code: 383k; RoHS: Y; Value1: 0.1%; MountType: SMT; PackageReference: 0603; Tolerance_%: 0.1%; Res_ohm: 383k; CompType: Resistor; LatestRevisionDate: 2017-03-09; PartNumber: RT0603BRD07383KL; AEC Qualified: ?; ComponentLink1Description: Datasheet link; Technology: Thin Film
R47 = CMP-0024106-3: RES, 31.2 k, 0.1%, 0.1 W, 0603; Manufacturer: Yageo America; Power_W: 100mW; TempCo: 25 ppm/C; Value_Code: 31k2; U/M: EA; Value: 31.2k; EIA_Code: E192; SizeX_mm: 1.6; SizeY_mm: 0.8; SizeZ_mm: 1; Value2: 0.1W; SizeArea_mm2: 1.28; VDC_V: 75V; AEC Category: Q200; Publisher: Texas Instruments; Published: 2008-06-26; RoHS: Y; Value1: 0.1%; MountType: SMT; PackageReference: 0603; Tolerance_%: 0.1%; Res_ohm: 31.2k; CompType: Resistor; LatestRevisionDate: 2017-03-09; PartNumber: RT0603BRD0731K2L; AEC Qualified: ?; ComponentLink1Description: Datasheet link; Technology: Thin Film; ComponentLink1URL: http://www.yageo.com/pdf/PYu-RT_1-to-0.05_RoHS_L_3.pdf
R51 = CMP-0025744-3: RES, 1.1, 5%, 0.1 W, 0603; Manufacturer: Vishay-Dale; Power_W: 100mW; TempCo: 200 ppm/C; Value_Code: 1R10; U/M: EA; Value: 1.1; EIA_Code: E24; SizeX_mm: 1.6; SizeY_mm: 0.8; SizeZ_mm: 1; Value2: 0.1W; SizeArea_mm2: 1.28; VDC_V: 75V; AEC Category: Q200; Supplier Part Number 2: 71-CRCW0603J-1.1-E3; Publisher: Texas Instruments; Supplier 2: Mouser; Published: 2008-06-26; RoHS: Y; Value1: 5%; MountType: SMT; Supplier 1: Digi-Key; PackageReference: 0603; Tolerance_%: 5%; Res_ohm: 1.1; CompType: Resistor; LatestRevisionDate: 2017-03-09; PartNumber: CRCW06031R10JNEA; AEC Qualified: ?; ComponentLink1Description: Datasheet link; Supplier Part Number 1: 541-1.1GCT-ND; Technology: Thick Film; ComponentLink1URL: http://www.vishay.com/docs/20035/dcrcwe3.pdf
R52 = CMP-0018933-2: Thick Film Resistors - SMD 0805 Anti-Surge Res. 0.1%, 249Kohm; Manufacturer: Panasonic; Power_W: 125mW; TempCo: 25 ppm/C; U/M: EA; Value: 249k; EIA_Code: E192; SizeX_mm: 2; SizeY_mm: 1.25; SizeZ_mm: 1.45; Value2: 0.125W; SizeArea_mm2: 2.5; VDC_V: 100V; AEC Category: Q200; Supplier Part Number 2: 754-RG2012P-2493-BT5; Publisher: Texas Instruments; Supplier 2: Mouser; Published: 2008-06-26; Value_Code: 249k; RoHS: Y; MountType: SMT; Supplier 1: Digi-Key; PackageReference: 0805; Tolerance_%: 0.1%; Res_ohm: 249k; CompType: Resistor; LatestRevisionDate: 2017-03-09; PartNumber: ERJ-PB6B2493V; AEC Qualified: ?; ComponentLink1Description: Datasheet link; Supplier Part Number 1: RG20P249KBCT-ND; Technology: Thin Film; ComponentLink1URL: http://www.susumu.co.jp/english/pdf/products-j01-01.pdf
R57 = CMP-0023733-2: RES, 13.7 k, 0.1%, 0.1 W, 0603; Manufacturer: Yageo America; Power_W: 100mW; TempCo: 25 ppm/C; Value_Code: 13k7; U/M: EA; Value: 13.7k; EIA_Code: E192; SizeX_mm: 1.6; SizeY_mm: 0.8; SizeZ_mm: 1; Value2: 0.1W; SizeArea_mm2: 1.28; VDC_V: 75V; AEC Category: Q200; Publisher: Texas Instruments; Published: 2008-06-26; RoHS: Y; Value1: 0.1%; MountType: SMT; PackageReference: 0603; Tolerance_%: 0.1%; Res_ohm: 13.7k; CompType: Resistor; LatestRevisionDate: 2017-03-09; PartNumber: RT0603BRD0713K7L; AEC Qualified: ?; ComponentLink1Description: Datasheet link; Technology: Thin Film; ComponentLink1URL: http://www.yageo.com/pdf/PYu-RT_1-to-0.05_RoHS_L_3.pdf
R58 = CMP-0024097-2: RES, 30.5 k, 0.1%, 0.1 W, 0603; Manufacturer: Yageo America; Power_W: 100mW; TempCo: 25 ppm/C; Value_Code: 30k5; U/M: EA; Value: 30.5k; EIA_Code: E192; SizeX_mm: 1.6; SizeY_mm: 0.8; SizeZ_mm: 1; Value2: 0.1W; SizeArea_mm2: 1.28; VDC_V: 75V; AEC Category: Q200; ComponentLink1URL: http://www.yageo.com/pdf/PYu-RT_1-to-0.05_RoHS_L_3.pdf; Publisher: Texas Instruments; Published: 2008-06-26; RoHS: Y; Value1: 0.1%; MountType: SMT; PackageReference: 0603; Tolerance_%: 0.1%; Res_ohm: 30.5k; CompType: Resistor; LatestRevisionDate: 2017-03-09; PartNumber: RT0603BRD0730K5L; AEC Qualified: ?; ComponentLink1Description: Datasheet link; Technology: Thin Film
R59 = CMP-0023735-1: RES, 13.0 k, 0.1%, 0.1 W, 0603; Manufacturer: Yageo America; Power_W: 100mW; TempCo: 25 ppm/C; Value_Code: 13k0; U/M: EA; Value: 13.0k; EIA_Code: E192; Res_ohm: 13k; SizeX_mm: 1.6; SizeY_mm: 0.8; SizeZ_mm: 1; Value2: 0.1W; SizeArea_mm2: 1.28; VDC_V: 75V; AEC Category: Q200; ComponentLink1URL: http://www.yageo.com/pdf/PYu-RT_1-to-0.05_RoHS_L_3.pdf; Publisher: Texas Instruments; Published: 2008-06-26; RoHS: Y; Value1: 0.1%; MountType: SMT; PackageReference: 0603; Tolerance_%: 0.1%; CompType: Resistor; LatestRevisionDate: 2017-03-09; PartNumber: RT0603BRD0713KL; AEC Qualified: ?; ComponentLink1Description: Datasheet link; Technology: Thin Film
R62 = CMP-0022735-5: RES, 100 k, 1%, 0.1 W, 0603; Manufacturer: Yageo; Power_W: 100mW; TempCo: 100 ppm/C; Value: 100k; EIA_Code: E96; SizeX_mm: 1.6; SizeY_mm: 0.8; SizeZ_mm: 1; Value2: 0.1W; SizeArea_mm2: 1.28; AEC Qualified: N; VDC_V: 75V; AEC Category: Q200; SizeAreaWB_mm2: 4.68; Supplier Part Number 2: 603-RC0603FR-07100KL; Supplier 2: Mouser; Supplier Part Number 3: 9238727; Supplier 3: Farnell; Value_Code: 100k; RoHS: Y; Value1: 1%; MountType: SMT; Supplier 1: Digi-Key; PackageReference: 0603; Tolerance_%: 1%; Res_ohm: 100k; CompType: Resistor; PartNumber: RC0603FR-07100KL; ComponentLink1Description: Datasheet link; Supplier Part Number 1: 311-100KHRCT-ND; Technology: Thick Film; ComponentLink1URL: http://www.yageo.com/pdf/Pu-RC0603_51_PbFree_L_2.pdf; AEC Grade: N/A
R63 R64 = CMP-0092857-1: Thick Film Resistors - SMD 1/8watt ZEROohm Jumper; Manufacturer: Vishay; Power_W: 500mW; SizeZ_mm: 0.6mm; AEC Qualified: Yes; TempCo: 200ppm/°C; VDC_V: 150V; Tolerance_%: 5%; AEC Grade: Grade 0; ComponentLink1URL: https://www.vishay.com/docs/20043/crcwhpe3.pdf; Part Number: CRCW08050000Z0EA; RoHS: TRUE; PartNumber: CRCW08050000Z0EA; Res_ohm: 0; helpURL: https://upverter.com/upn/revision/5f84fa7f25e15205/; Operating Temperature Range: -55°C to +155°C; Datasheet Path: datasheets/Res-CRCW080510R0JNEAHP.pdf; ComponentLink1Description: Datasheet; Lead Free: Yes; Technology: Thick Film; Series: CRCW-HP e3; PackageReference: 0805; datasheet: https://www.vishay.com/docs/20043/crcwhpe3.pdf
R65 = CMP-0023086-5: RES, 3.60 k, 1%, 0.1 W, 0603; Manufacturer: Yageo; Power_W: 100mW; TempCo: 100 ppm/C; Value_Code: 3k60; Value: 3.60k; Res_ohm: 3.6k; SizeX_mm: 1.6; SizeY_mm: 0.8; SizeZ_mm: 1; Value2: 0.1W; SizeArea_mm2: 1.28; AEC Qualified: N; VDC_V: 75V; AEC Category: Q200; SizeAreaWB_mm2: 4.68; Supplier Part Number 2: 603-RC0603FR-073K6L; Supplier 2: Mouser; Supplier Part Number 3: 1799338; Supplier 3: Farnell; RoHS: Y; Value1: 1%; MountType: SMT; Supplier 1: Digi-Key; PackageReference: 0603; Tolerance_%: 1%; CompType: Resistor; PartNumber: RC0603FR-073K6L; ComponentLink1Description: Datasheet link; Supplier Part Number 1: 311-3.60KHRCT-ND; Technology: Thick Film; ComponentLink1URL: http://www.yageo.com/pdf/Pu-RC0603_51_PbFree_L_2.pdf; AEC Grade: N/A
R67-R70 = CMP-0078781-1: RES, 10.5 k, 1%, 0.063 W, 0402; Manufacturer: Yageo America; Value_Code: 10k5; SizeArea_mm2: 0.5; AEC Qualified: N; AEC Category: Q200; Value: 10.5k; SizeZ_mm: 0.6; EIA_Code: E96; TempCo: 100 ppm/C; Power_W: 63mW; VDC_V: 50V; Value2: 0.063W; SizeX_mm: 1; ComponentLink1Description: Datasheet link; RoHS: Y; Supplier Part Number 3: 603-RC0402FR-0710K5L; Tolerance_%: 1%; Supplier 1: Digi-Key; PackageReference: 0402; Technology: Thick Film; Res_ohm: 10.5k; PartNumber: RC0402FR-0710K5L; Supplier Part Number 2: 66R1118; Supplier 2: Newark; AEC Grade: N/A; SizeY_mm: 0.5; ComponentLink1URL: http://www.yageo.com/documents/recent/PYu-RC_Group_51_RoHS_L_8.pdf; Value1: 1%; CompType: Resistor; MountType: SMT; Supplier Part Number 1: YAG2951CT-ND; Supplier 3: Mouser
R71 = CMP-0023607-3: RES, 8.20 k, 0.1%, 0.1 W, 0603; Manufacturer: Susumu Co Ltd; Power_W: 100mW; TempCo: 25 ppm/C; Value_Code: 8k20; U/M: EA; Value: 8.20k; Res_ohm: 8.2k; SizeX_mm: 1.6; SizeY_mm: 0.8; SizeZ_mm: 1; Value2: 0.1W; SizeArea_mm2: 1.28; VDC_V: 75V; AEC Category: Q200; Supplier Part Number 2: 754-RG1608P-822-BT5; Publisher: Texas Instruments; Supplier 2: Mouser; Published: 2008-06-26; RoHS: Y; Value1: 0.1%; MountType: SMT; Supplier 1: Digi-Key; PackageReference: 0603; Tolerance_%: 0.1%; CompType: Resistor; LatestRevisionDate: 2017-03-09; PartNumber: RG1608P-822-B-T5; AEC Qualified: ?; ComponentLink1Description: Datasheet link; Supplier Part Number 1: RG16P8.2KBCT-ND; Technology: Metal Film; ComponentLink1URL: http://www.susumu.co.jp/english/pdf/products-j01-01.pdf
U7 = BQ25756RRVR: Stand-alone or I&sup2;C-controlled 70-V bidirectional buck-boost charge controller with MPPT 36-VQFN -40 to 125; Manufacturer_Name: Texas Instruments; Type: Interface; Copyright: Copyright (C) 2025 Ultra Librarian. All rights reserved.; Manufacturer_Part_Number: BQ25756RRVR; RefDes: RefDes